# Altium schematic sheet Top_Section.SchDoc
size 420 x 297 mm; SheetNumber: 1; SheetTotal: 4
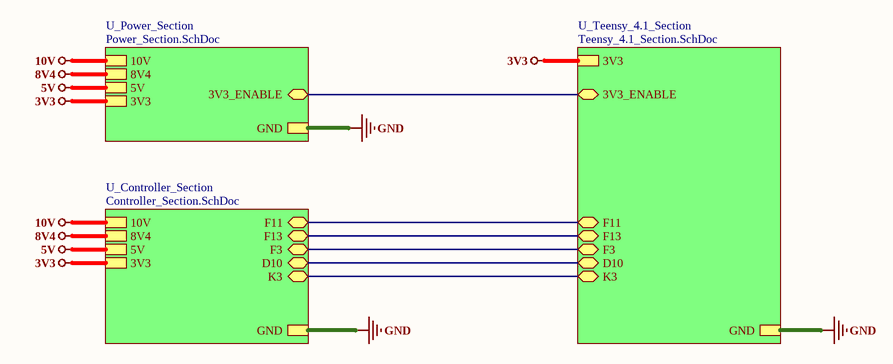
[diagram p0: Top_Section.SchDoc]

## Sub-sheets
U_Controller_Section = Controller_Section.SchDoc: 8V4, GND, 10V, 5V, 3V3, F11 (bidir), F13 (bidir), F3 (bidir), D10 (bidir), K3 (bidir)
U_Power_Section = Power_Section.SchDoc: 8V4, GND, 10V, 5V, 3V3, 3V3_ENABLE (bidir)
U_Teensy_4.1_Section = Teensy_4.1_Section.SchDoc: GND, 3V3, 3V3_ENABLE (bidir), F11 (bidir), F13 (bidir), F3 (bidir), D10 (bidir), K3 (bidir)

## Nets
3V3: sheet U_Power_Section/3V3, sheet U_Controller_Section/3V3, sheet U_Teensy_4.1_Section/3V3
5V: sheet U_Power_Section/5V, sheet U_Controller_Section/5V
8V4: sheet U_Power_Section/8V4, sheet U_Controller_Section/8V4
10V: sheet U_Power_Section/10V, sheet U_Controller_Section/10V
GND: sheet U_Power_Section/GND, sheet U_Controller_Section/GND, sheet U_Teensy_4.1_Section/GND
(unnamed): sheet U_Power_Section/3V3_ENABLE, sheet U_Teensy_4.1_Section/3V3_ENABLE
(unnamed): sheet U_Controller_Section/F11, sheet U_Teensy_4.1_Section/F11
(unnamed): sheet U_Controller_Section/F13, sheet U_Teensy_4.1_Section/F13
(unnamed): sheet U_Controller_Section/F3, sheet U_Teensy_4.1_Section/F3
(unnamed): sheet U_Controller_Section/D10, sheet U_Teensy_4.1_Section/D10
(unnamed): sheet U_Controller_Section/K3, sheet U_Teensy_4.1_Section/K3

## Notes on the sheet
- File:
- Title:
- Date:
- Page
- Num:
- Total:
- Drawn By: Huzaifa Ali